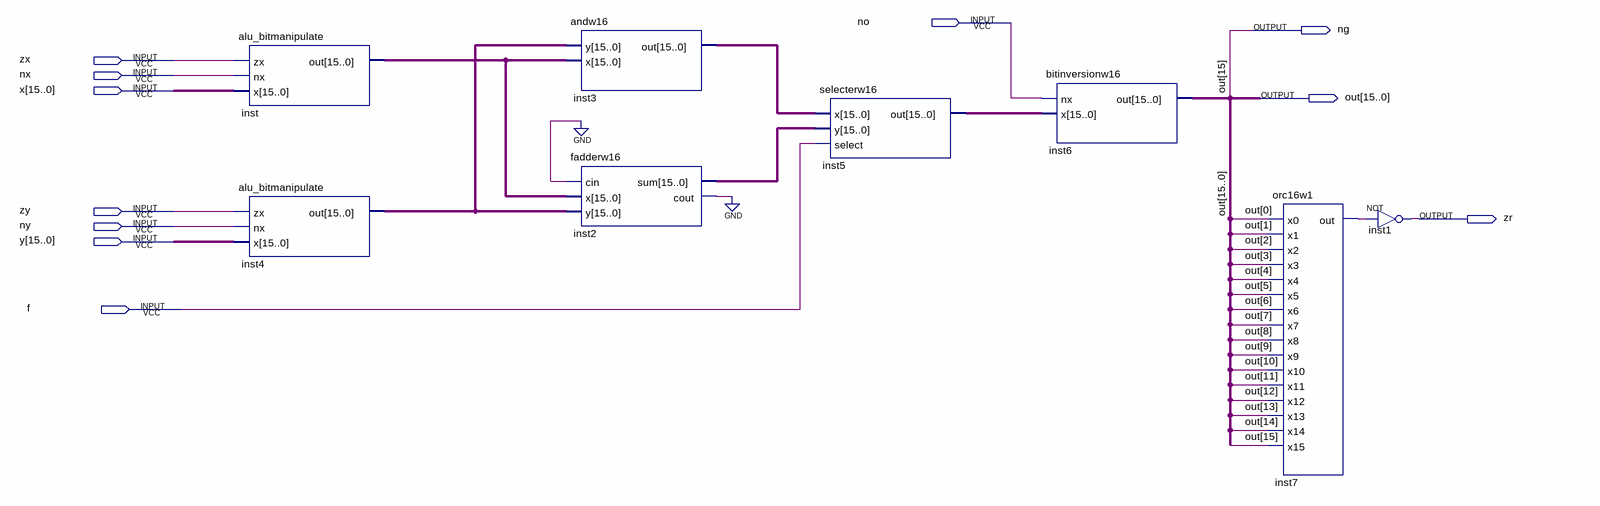
[diagram p0: schematic sheet]
// Quartus schematic alu.bdf as structural Verilog: 8 symbols, 11 pins
module alu (
  input  no,
  input  zx,
  input  nx,
  input  [15:0] x,
  input  zy,
  input  ny,
  input  [15:0] y,
  input  f,
  output ng,
  output [15:0] out,
  output zr
);

  wire inst2_cout, inst7_out;
  wire [15:0] inst2_sum, inst3_out, inst4_out, inst5_out, inst_out;

  alu_bitmanipulate inst (.zx(zx), .nx(nx), .x(x), .out(inst_out));
  alu_bitmanipulate inst4 (.zx(zy), .nx(ny), .x(y), .out(inst4_out));
  andw16 inst3 (.y(inst4_out), .x(inst_out), .out(inst3_out));
  fadderw16 inst2 (.cin(1'b0), .x(inst_out), .y(inst4_out), .sum(inst2_sum), .cout(inst2_cout));
  selecterw16 inst5 (.x(inst3_out), .y(inst2_sum), .select(f), .out(inst5_out));
  bitinversionw16 inst6 (.nx(no), .x(inst5_out), .out({ng, out[14:0]}));
  orc16w1 inst7 (
    .x0(out[0]), .x1(out[1]), .x2(out[2]), .x3(out[3]), .x4(out[4]), .x5(out[5]), .x6(out[6]), .x7(out[7]),
    .x8(out[8]), .x9(out[9]), .x10(out[10]), .x11(out[11]), .x12(out[12]), .x13(out[13]), .x14(out[14]),
    .x15(ng), .out(inst7_out));
  not inst1 (zr, inst7_out);

  assign out[15] = ng;
  // also tied to GND on the sheet: inst2_cout
endmodule
